# Altium schematic sheet TopSheet.SchDoc
size A4; Organization: Altium Limited; Address1: L3, 12a Rodborough Rd; Address2: Frenchs Forest; Address3: NSW; Address4: Australia 2086; DocumentNumber: 1; SheetNumber: 1; SheetTotal: 8
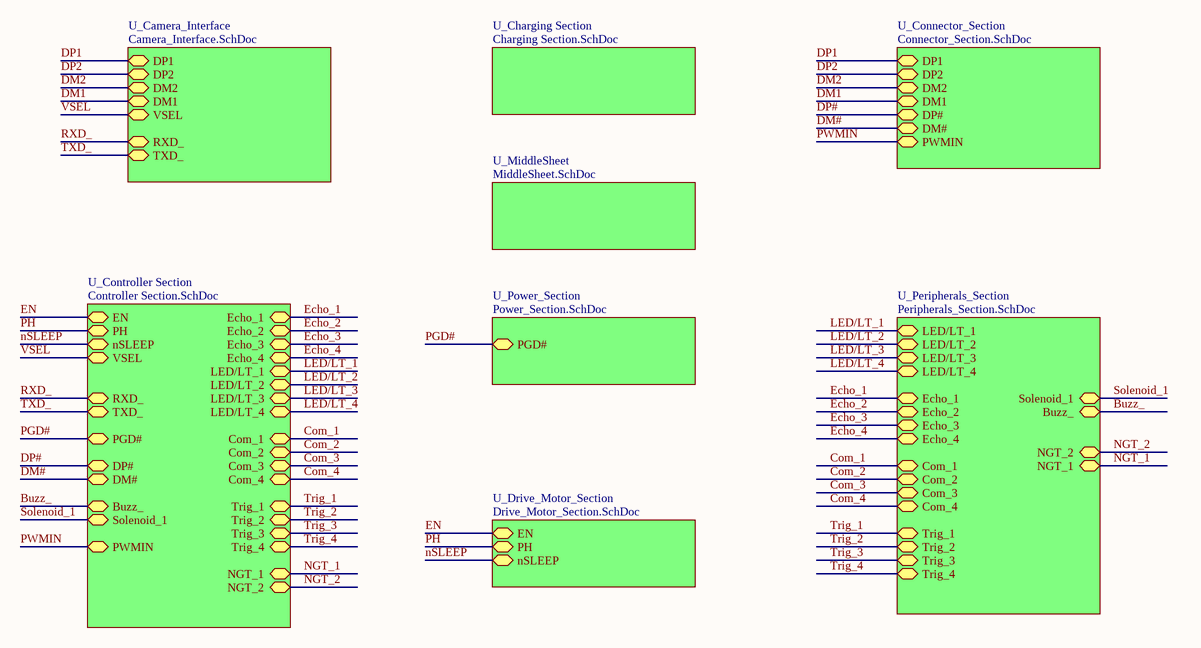
[diagram p0: TopSheet.SchDoc]

## Sub-sheets
U_Camera_Interface = Camera_Interface.SchDoc: DP1 (bidir), DP2 (bidir), DM2 (bidir), DM1 (bidir), VSEL (bidir), RXD_ (bidir), TXD_ (bidir)
U_Charging Section = Charging Section.SchDoc: no entries
U_Connector_Section = Connector_Section.SchDoc: DP1 (bidir), DP2 (bidir), DM2 (bidir), DM1 (bidir), DP# (bidir), DM# (bidir), PWMIN (bidir)
U_Controller Section = Controller Section.SchDoc: EN (bidir), PH (bidir), nSLEEP (bidir), VSEL (bidir), NGT_2 (bidir), Echo_3 (bidir), Echo_1 (bidir), LED/LT_2 (bidir), LED/LT_4 (bidir), Trig_4 (bidir), PGD# (bidir), NGT_1 (bidir), Buzz_ (bidir), Com_4 (bidir), Echo_2 (bidir), DM# (bidir), Com_3 (bidir), LED/LT_3 (bidir), Trig_1 (bidir), Solenoid_1 (bidir), Echo_4 (bidir), Com_1 (bidir), DP# (bidir), Trig_3 (bidir), Trig_2 (bidir), LED/LT_1 (bidir), Com_2 (bidir), PWMIN (bidir), TXD_ (bidir), RXD_ (bidir)
U_Drive_Motor_Section = Drive_Motor_Section.SchDoc: EN (bidir), PH (bidir), nSLEEP (bidir)
U_MiddleSheet = MiddleSheet.SchDoc: no entries
U_Peripherals_Section = Peripherals_Section.SchDoc: Solenoid_1 (bidir), LED/LT_4 (bidir), LED/LT_3 (bidir), LED/LT_2 (bidir), LED/LT_1 (bidir), Buzz_ (bidir), Echo_1 (bidir), Echo_4 (bidir), Echo_3 (bidir), Echo_2 (bidir), Com_4 (bidir), Com_2 (bidir), Com_1 (bidir), Com_3 (bidir), Trig_4 (bidir), Trig_3 (bidir), Trig_2 (bidir), Trig_1 (bidir), NGT_2 (bidir), NGT_1 (bidir)
U_Power_Section = Power_Section.SchDoc: PGD# (bidir)

## Nets
Buzz_: sheet U_Controller Section/Buzz_, sheet U_Peripherals_Section/Buzz_
Com_1: sheet U_Controller Section/Com_1, sheet U_Peripherals_Section/Com_1
Com_2: sheet U_Controller Section/Com_2, sheet U_Peripherals_Section/Com_2
Com_3: sheet U_Controller Section/Com_3, sheet U_Peripherals_Section/Com_3
Com_4: sheet U_Controller Section/Com_4, sheet U_Peripherals_Section/Com_4
DM1: sheet U_Camera_Interface/DM1, sheet U_Connector_Section/DM1
DM2: sheet U_Camera_Interface/DM2, sheet U_Connector_Section/DM2
DM#: sheet U_Connector_Section/DM#, sheet U_Controller Section/DM#
DP1: sheet U_Camera_Interface/DP1, sheet U_Connector_Section/DP1
DP2: sheet U_Camera_Interface/DP2, sheet U_Connector_Section/DP2
DP#: sheet U_Connector_Section/DP#, sheet U_Controller Section/DP#
Echo_1: sheet U_Controller Section/Echo_1, sheet U_Peripherals_Section/Echo_1
Echo_2: sheet U_Controller Section/Echo_2, sheet U_Peripherals_Section/Echo_2
Echo_3: sheet U_Controller Section/Echo_3, sheet U_Peripherals_Section/Echo_3
Echo_4: sheet U_Controller Section/Echo_4, sheet U_Peripherals_Section/Echo_4
EN: sheet U_Controller Section/EN, sheet U_Drive_Motor_Section/EN
LED/LT_1: sheet U_Controller Section/LED/LT_1, sheet U_Peripherals_Section/LED/LT_1
LED/LT_2: sheet U_Controller Section/LED/LT_2, sheet U_Peripherals_Section/LED/LT_2
LED/LT_3: sheet U_Controller Section/LED/LT_3, sheet U_Peripherals_Section/LED/LT_3
LED/LT_4: sheet U_Controller Section/LED/LT_4, sheet U_Peripherals_Section/LED/LT_4
NGT_1: sheet U_Controller Section/NGT_1, sheet U_Peripherals_Section/NGT_1
NGT_2: sheet U_Controller Section/NGT_2, sheet U_Peripherals_Section/NGT_2
nSLEEP: sheet U_Controller Section/nSLEEP, sheet U_Drive_Motor_Section/nSLEEP
PGD#: sheet U_Controller Section/PGD#, sheet U_Power_Section/PGD#
PH: sheet U_Controller Section/PH, sheet U_Drive_Motor_Section/PH
PWMIN: sheet U_Connector_Section/PWMIN, sheet U_Controller Section/PWMIN
RXD_: sheet U_Camera_Interface/RXD_, sheet U_Controller Section/RXD_
Solenoid_1: sheet U_Controller Section/Solenoid_1, sheet U_Peripherals_Section/Solenoid_1
Trig_1: sheet U_Controller Section/Trig_1, sheet U_Peripherals_Section/Trig_1
Trig_2: sheet U_Controller Section/Trig_2, sheet U_Peripherals_Section/Trig_2
Trig_3: sheet U_Controller Section/Trig_3, sheet U_Peripherals_Section/Trig_3
Trig_4: sheet U_Controller Section/Trig_4, sheet U_Peripherals_Section/Trig_4
TXD_: sheet U_Camera_Interface/TXD_, sheet U_Controller Section/TXD_
VSEL: sheet U_Camera_Interface/VSEL, sheet U_Controller Section/VSEL

## Notes on the sheet
- Title
- Size:
- Date:
- A4
- Number:
- Time:
- Revision:
- Sheet
- of
- File: